# Altium schematic sheet Sheet1.SchDoc: LM75
size 410 x 297 mm; ApprovedBy: Стерхов В.Д,; CheckedBy: Стерхов В.Д,; Author: Сергеев Д.А.; CompanyName: ГК "СНАБЖЕНИЕ"; DrawnBy: Сергеев Д.А.; Engineer: Сергеев Д.А.; Organization: ГК "СНАБЖЕНИЕ"; DocumentNumber: ИЛ1337ТО1/1; Revision: 1; SheetNumber: 1; SheetTotal: 1
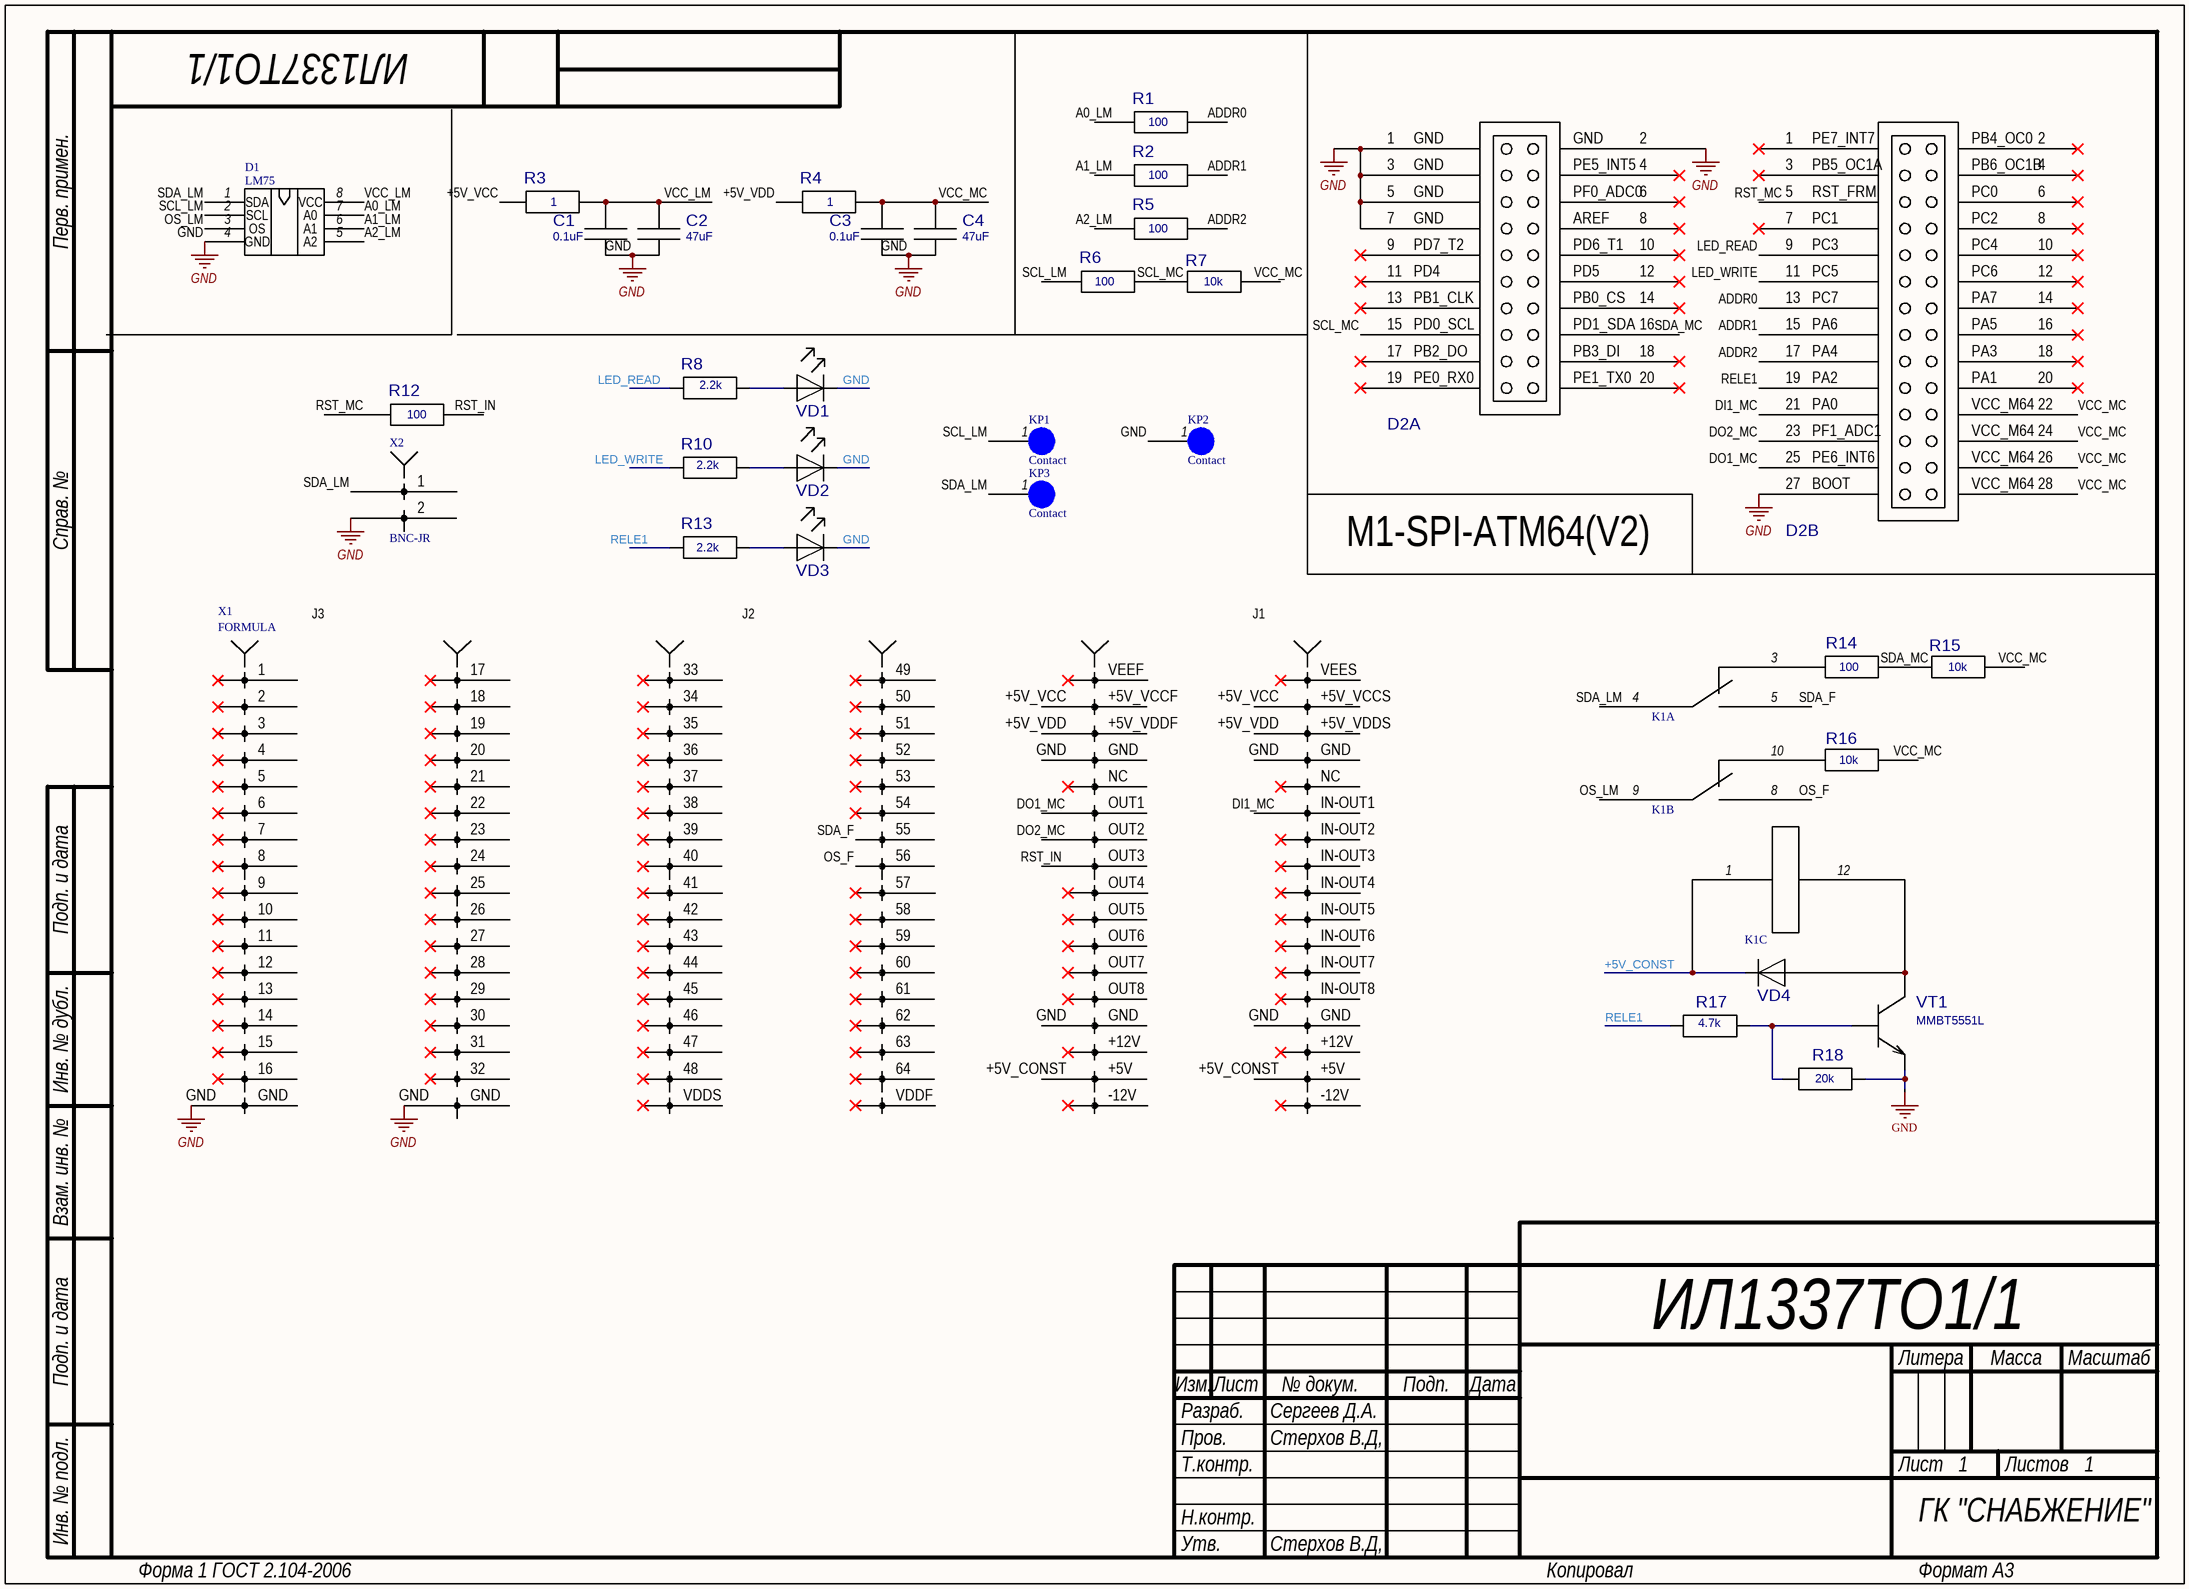
[diagram p0: Sheet1.SchDoc]

## Parts
C1  0.1uF  [0805]
C2  47uF  [0805]
C3  0.1uF  [0805]
C4  47uF  [0805]
D1  LM75  [LM75]
D2  M1-SPI-ATM64(V2)  [M1-SPI-ATM64(V2)]  (value not drawn)  (parts A,B of 2)
K1  V23079A1001B301 TE  [V23079A1001B301]  (value not drawn)  (parts A,B,C of 3)
KP1  Contact  [Contact]
KP2  Contact  [Contact]
KP3  Contact  [Contact]
R1  100  [0805]
R2  100  [0805]
R3  1  [0805]
R4  1  [0805]
R5  100  [0805]
R6  100  [0805]
R7  10k  [0805]
R8  2.2k  [0805]
R10  2.2k  [0805]
R12  100  [0805]
R13  2.2k  [0805]
R14  100  [0805]
R15  10k  [0805]
R16  10k  [0805]
R17  4.7k  [0805]
R18  20k  [0805]
VD1  LED(0805)  [0805(LED)]  (value not drawn)
VD2  LED(0805)  [0805(LED)]  (value not drawn)
VD3  LED(0805)  [0805(LED)]  (value not drawn)
VD4  LL4148 NXP  [SOD80C]  (value not drawn)
VT1  MMBT5551L  [SOT-23]
X1  FORMULA  [FORMULA]
X2  BNC-JR  [BNC-JR]

## Nets
GND: C1.2 C2.2 C3.2 C4.2 D1.4 D2.1X2 D2.2X2 D2.3X2 D2.5X2 D2.7X2 D2.27X3 KP2.1 R18.2 VD1.2(K) VD2.2(K) VD3.2(K) VT1.2(E) X1.GND X2.2
+5V_CONST: K1.1 VD4.2(K) X1.+5V
+5V_VCC: R3.1 X1.+5V_VCCF(VCCF) X1.+5V_VCCS(VCCS)
+5V_VDD: R4.1 X1.+5V_VDDF(VDDF) X1.+5V_VDDS(VDDS)
A0_LM: D1.7 R1.1
A1_LM: D1.6 R2.1
A2_LM: D1.5 R5.1
ADDR0: D2.13X3 R1.2
ADDR1: D2.15X3 R2.2
ADDR2: D2.17X3 R5.2
DI1_MC: D2.21X3 X1.IN-OUT1
DO1_MC: D2.25X3 X1.OUT1
DO2_MC: D2.23X3 X1.OUT2
LED_READ: D2.9X3 R8.1
LED_WRITE: D2.11X3 R10.1
OS_F: K1.8 X1.56
OS_LM: D1.3 K1.9
RELE1: D2.19X3 R13.1 R17.1
RST_IN: R12.2 X1.OUT3
RST_MC: D2.5X3 R12.1
SCL_LM: D1.2 KP1.1 R6.1
SCL_MC: D2.15X2 R6.2 R7.1
SDA_F: K1.5 X1.55
SDA_LM: D1.1 K1.4 KP3.1 X2.1
SDA_MC: D2.16X2 R14.2 R15.1
VCC_LM: C1.1 C2.1 D1.8 R3.2
VCC_MC: C3.1 C4.1 D2.22X3 D2.24X3 D2.26X3 D2.28X3 R4.2 R7.2 R15.2 R16.2
NetK1_3: K1.3 R14.1
NetK1_10: K1.10 R16.1
NetK1_12: K1.12 VD4.1(A) VT1.3(K)
NetR8_2: R8.2 VD1.1(A)
NetR10_2: R10.2 VD2.1(A)
NetR13_2: R13.2 VD3.1(A)
NetR17_2: R17.2 R18.1 VT1.1(B)

Not connected (* = marked no-connect by the designer): D2 1X3* 2X3* 3X3* 4X2* 4X3* 6X2* 6X3* 7X3* 8X2* 8X3* 9X2* 10X2* 10X3* 11X2* 12X2* 12X3* 13X2* 14X2* 14X3* 16X3* 17X2* 18X2* 18X3* 19X2* 20X2* 20X3*; X1 1* 2* 3* 4* 5* 6* 7* 8* 9* 10* 11* 12* 13* 14* 15* 16* 17* 18* 19* 20* 21* 22* 23* 24* 25* 26* 27* 28* 29* 30* 31* 32* 33* 34* 35* 36(4)* 37(5)* 38* 39* 40* 41* 42* 43* 44* 45* 46* 47* 48* 49* 50* 51* 52* 53* 54* 57* 58* 59* 60* 61* 62* 63* 64* +12V* -12V* IN-OUT2* IN-OUT3* IN-OUT4* IN-OUT5* IN-OUT6* IN-OUT7* IN-OUT8* NC* OUT4* OUT5* OUT6* OUT7* OUT8* VDDF* VDDS* VEEF* VEES*

## Notes on the sheet
- M1-SPI-ATM64(V2)
- Перв. примен.
- Справ. №
- Подп. и дата
- Инв. № дубл.
- Взам. инв. №
- Разраб.
- Изм.
- Лист
- № докум.
- Подп.
- Дата
- Литера
- Масса
- Масштаб
- Пров.
- Т.контр.
- Листов
- Инв. № подл.
- Н.контр.
- Утв.
- Форма 1 ГОСТ 2.104-2006
- Копировал
- Формат А3
- (in symbol FORMULA) J3; J2; J1
- (in symbol LM75) SDA; VCC; SCL; A0; OS; A1; GND; A2
- (in symbol M1-SPI-ATM64(V2), part A) GND; 3; PE5_INT5; 4; 5; PF0_ADC0; 6; 7; AREF; 8; 9; PD7_T2; PD6_T1; 10; 11; PD4; PD5; 12; 13; PB1_CLK; PB0_CS; 14; 15; PD0_SCL; PD1_SDA; 16; 17; PB2_DO; PB3_DI; 18; 19; PE0_RX0; PE1_TX0; 20
- (in symbol M1-SPI-ATM64(V2), part B) PE7_INT7; PB4_OC0; 3; PB5_OC1A; PB6_OC1B; 4; 5; RST_FRM; PC0; 6; 7; PC1; PC2; 8; 9; PC3; PC4; 10; 11; PC5; PC6; 12; 13; PC7; PA7; 14; 15; PA6; PA5; 16; 17; PA4; PA3; 18; 19; PA2; PA1; 20; 21; PA0; VCC_M64; 22; 23; PF1_ADC1; 24; 25; PE6_INT6; 26; 27; BOOT; 28

## Library data of the parts
C1-C4 = C0805: ComponentHeigt: 1.3; Firme: AVX; Leadform: SMD; KIND: Конденсатор; ClassName: *; Component Link: *; ComponentWeigt: *; Packaging: 0805; NN: *; Value: *
D2 = M1-SPI-ATM64(V2): ComponentHeigt: 5.5; Name: Вилка; Specification: Вилка PLD2-2 *; Typ: PLD2-2; ClassName: *; Component Link: *; ComponentWeigt: *; Firme: *; Leadform: *; NN: *; KIND: *
R1-R8 R10 R12-R18 = R0805 Yageo: ComponentHeigt: 0.6; Firme: Yageo; Leadform: SMD; Kind: Резистор; ClassName: *; ComponentWeigt: *; Component Link: *; Packaging: 0805; NN: *; Value: *
VD1-VD3 = LED(0805): ComponentHeigt: 0.75; Leadform: в отверстия; Firme: Kingbright; NN: 24003000; KIND: Светодиод L-1154GD Kingbright; Component Link: *; ClassName: *
VD4 = LL4148 NXP: ComponentHeigt: 1.6; Leadform: SMD; NN: 24009301; KIND: Диод LL4148 NXP; Component Link: http://www.nxp.com; Packaging: SOD-80C; ClassName: *; Firme: NXP
VT1 = MMBT5551L: ComponentHeigt: 1.1; Firme: ONS; Leadform: SMD; NN: 24007468; KIND: Транзистор MMBT5551L*G ONS; ClassName: *; ComponentWeigt: *; Packaging: SOT-23